# Altium schematic sheet 12XC7K325T_FMC_LPC.SchDoc
size 304 x 190 mm
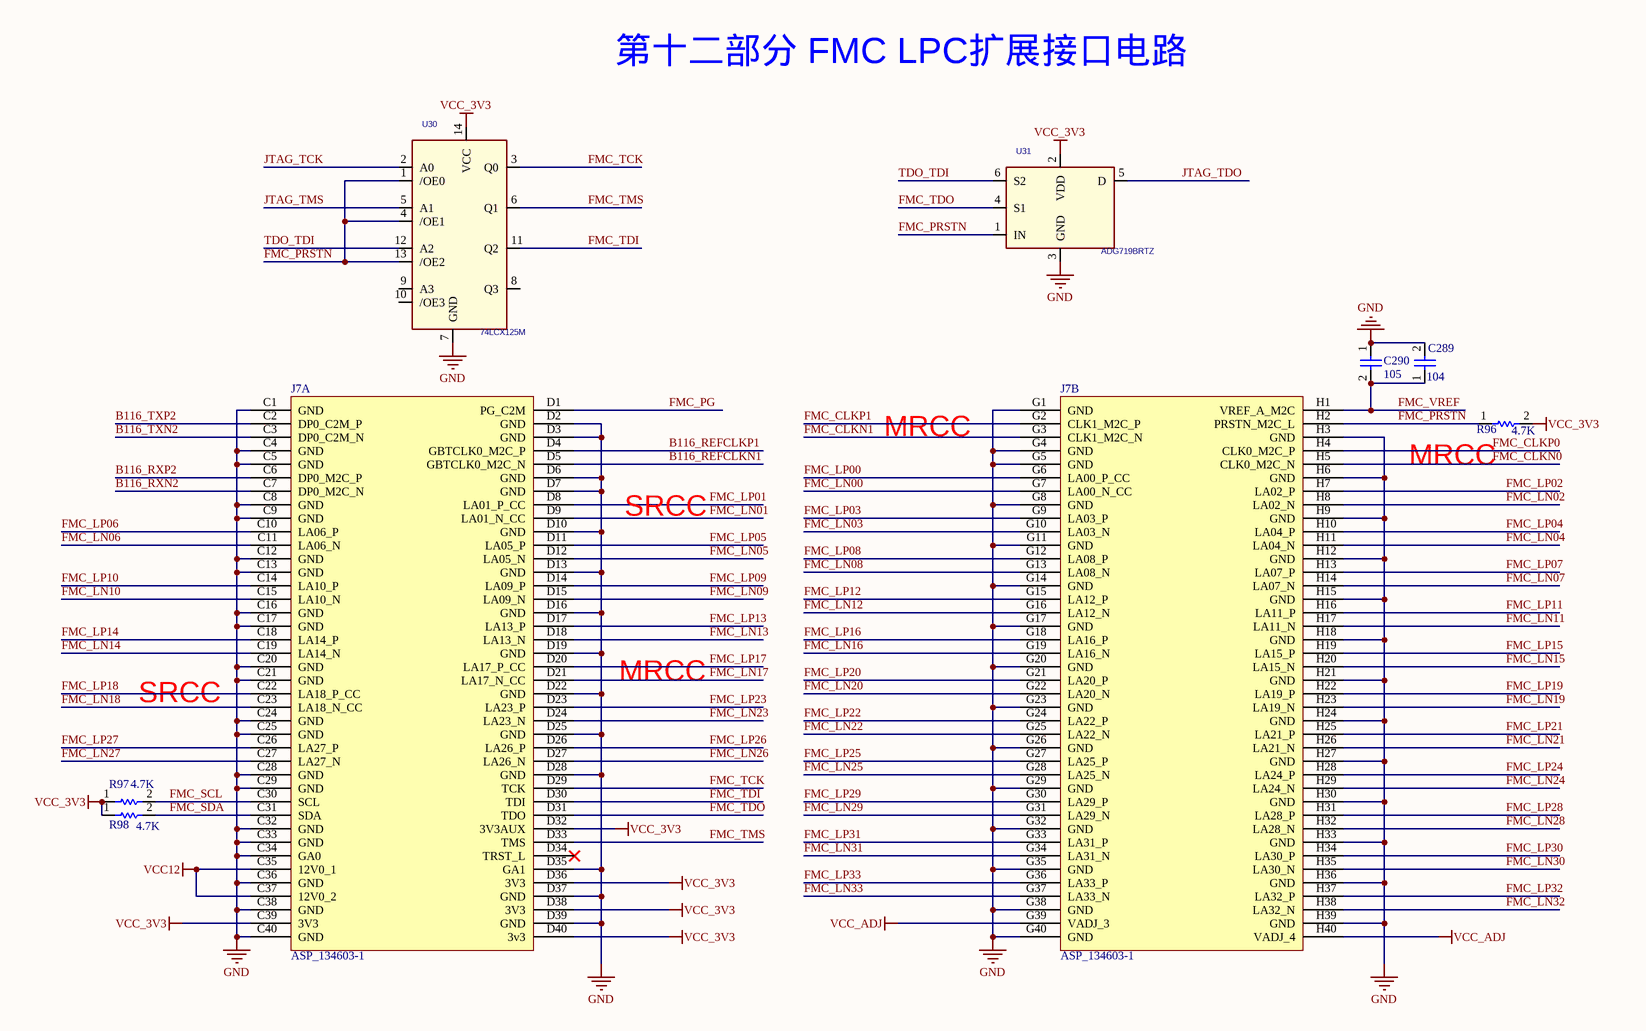
[diagram p0: 12XC7K325T_FMC_LPC.SchDoc]

## Parts
C289  104  [0402]
C290  105  [0402]
J7  ASP_134603-1  [ASP-134603-01]  (parts A,B of 2)
R96  4.7K  [0402]
R97  4.7K  [0402]
R98  4.7K  [0402]
U30  74LCX125M  [74LCX125M]
U31  ADG719BRTZ  [SOT23-6]

## Nets
GND: C289.2 C290.1 J7.C1(GND) J7.C4(GND) J7.C5(GND) J7.C8(GND) J7.C9(GND) J7.C12(GND) J7.C13(GND) J7.C16(GND) J7.C17(GND) J7.C20(GND) J7.C21(GND) J7.C24(GND) J7.C25(GND) J7.C28(GND) J7.C29(GND) J7.C32(GND) J7.C33(GND) J7.C34(GA0) J7.C36(GND) J7.C38(GND) J7.C40(GND) J7.D2(GND) J7.D3(GND) J7.D6(GND) J7.D7(GND) J7.D10(GND) J7.D13(GND) J7.D16(GND) J7.D19(GND) J7.D22(GND) J7.D25(GND) J7.D28(GND) J7.D35(GA1) J7.D37(GND) J7.D39(GND) J7.G1(GND) J7.G4(GND) J7.G5(GND) J7.G8(GND) J7.G11(GND) J7.G14(GND) J7.G17(GND) J7.G20(GND) J7.G23(GND) J7.G26(GND) J7.G29(GND) J7.G32(GND) J7.G35(GND) J7.G38(GND) J7.G40(GND) J7.H3(GND) J7.H6(GND) J7.H9(GND) J7.H12(GND) J7.H15(GND) J7.H18(GND) J7.H21(GND) J7.H24(GND) J7.H27(GND) J7.H30(GND) J7.H33(GND) J7.H36(GND) J7.H39(GND) U30.7(GND) U31.3(GND)
VCC12: J7.C35(12V0_1) J7.C37(12V0_2)
VCC_3V3: J7.C39(3V3) J7.D32(3V3AUX) J7.D36(3V3) J7.D38(3V3) J7.D40(3v3) R96.2 R97.1 R98.1 U30.14(VCC) U31.2(VDD)
VCC_ADJ: J7.G39(VADJ_3) J7.H40(VADJ_4)
B116_REFCLKN1: J7.D5(GBTCLK0_M2C_N)
B116_REFCLKP1: J7.D4(GBTCLK0_M2C_P)
B116_RXN2: J7.C7(DP0_M2C_N)
B116_RXP2: J7.C6(DP0_M2C_P)
B116_TXN2: J7.C3(DP0_C2M_N)
B116_TXP2: J7.C2(DP0_C2M_P)
FMC_CLKN0: J7.H5(CLK0_M2C_N)
FMC_CLKN1: J7.G3(CLK1_M2C_N)
FMC_CLKP0: J7.H4(CLK0_M2C_P)
FMC_CLKP1: J7.G2(CLK1_M2C_P)
FMC_LN00: J7.G7(LA00_N_CC)
FMC_LN01: J7.D9(LA01_N_CC)
FMC_LN02: J7.H8(LA02_N)
FMC_LN03: J7.G10(LA03_N)
FMC_LN04: J7.H11(LA04_N)
FMC_LN05: J7.D12(LA05_N)
FMC_LN06: J7.C11(LA06_N)
FMC_LN07: J7.H14(LA07_N)
FMC_LN08: J7.G13(LA08_N)
FMC_LN09: J7.D15(LA09_N)
FMC_LN10: J7.C15(LA10_N)
FMC_LN11: J7.H17(LA11_N)
FMC_LN12: J7.G16(LA12_N)
FMC_LN13: J7.D18(LA13_N)
FMC_LN14: J7.C19(LA14_N)
FMC_LN15: J7.H20(LA15_N)
FMC_LN16: J7.G19(LA16_N)
FMC_LN17: J7.D21(LA17_N_CC)
FMC_LN18: J7.C23(LA18_N_CC)
FMC_LN19: J7.H23(LA19_N)
FMC_LN20: J7.G22(LA20_N)
FMC_LN21: J7.H26(LA21_N)
FMC_LN22: J7.G25(LA22_N)
FMC_LN23: J7.D24(LA23_N)
FMC_LN24: J7.H29(LA24_N)
FMC_LN25: J7.G28(LA25_N)
FMC_LN26: J7.D27(LA26_N)
FMC_LN27: J7.C27(LA27_N)
FMC_LN28: J7.H32(LA28_N)
FMC_LN29: J7.G31(LA29_N)
FMC_LN30: J7.H35(LA30_N)
FMC_LN31: J7.G34(LA31_N)
FMC_LN32: J7.H38(LA32_N)
FMC_LN33: J7.G37(LA33_N)
FMC_LP00: J7.G6(LA00_P_CC)
FMC_LP01: J7.D8(LA01_P_CC)
FMC_LP02: J7.H7(LA02_P)
FMC_LP03: J7.G9(LA03_P)
FMC_LP04: J7.H10(LA04_P)
FMC_LP05: J7.D11(LA05_P)
FMC_LP06: J7.C10(LA06_P)
FMC_LP07: J7.H13(LA07_P)
FMC_LP08: J7.G12(LA08_P)
FMC_LP09: J7.D14(LA09_P)
FMC_LP10: J7.C14(LA10_P)
FMC_LP11: J7.H16(LA11_P)
FMC_LP12: J7.G15(LA12_P)
FMC_LP13: J7.D17(LA13_P)
FMC_LP14: J7.C18(LA14_P)
FMC_LP15: J7.H19(LA15_P)
FMC_LP16: J7.G18(LA16_P)
FMC_LP17: J7.D20(LA17_P_CC)
FMC_LP18: J7.C22(LA18_P_CC)
FMC_LP19: J7.H22(LA19_P)
FMC_LP20: J7.G21(LA20_P)
FMC_LP21: J7.H25(LA21_P)
FMC_LP22: J7.G24(LA22_P)
FMC_LP23: J7.D23(LA23_P)
FMC_LP24: J7.H28(LA24_P)
FMC_LP25: J7.G27(LA25_P)
FMC_LP26: J7.D26(LA26_P)
FMC_LP27: J7.C26(LA27_P)
FMC_LP28: J7.H31(LA28_P)
FMC_LP29: J7.G30(LA29_P)
FMC_LP30: J7.H34(LA30_P)
FMC_LP31: J7.G33(LA31_P)
FMC_LP32: J7.H37(LA32_P)
FMC_LP33: J7.G36(LA33_P)
FMC_PG: J7.D1(PG_C2M)
FMC_PRSTN: J7.H2(PRSTN_M2C_L) R96.1 U30.1(/OE0) U30.4(/OE1) U30.13(/OE2) U31.1(IN)
FMC_SCL: J7.C30(SCL) R97.2
FMC_SDA: J7.C31(SDA) R98.2
FMC_TCK: J7.D29(TCK) U30.3(Q0)
FMC_TDI: J7.D30(TDI) U30.11(Q2)
FMC_TDO: J7.D31(TDO) U31.4(S1)
FMC_TMS: J7.D33(TMS) U30.6(Q1)
FMC_VREF: C289.1 C290.2 J7.H1(VREF_A_M2C)
JTAG_TCK: U30.2(A0)
JTAG_TDO: U31.5(D)
JTAG_TMS: U30.5(A1)
TDO_TDI: U30.12(A2) U31.6(S2)

Not connected (* = marked no-connect by the designer): J7 D34(TRST_L)*; U30 8(Q3) 9(A3) 10(/OE3)

## Notes on the sheet
- 第十二部分 FMC LPC扩展接口电路
- MRCC
- (near R96) MRCC
- SRCC

## Library data of the parts
C289 C290 = 无极性电容
J7 = ASP_134604-1
R96-R98 = 电阻